# Altium schematic sheet Sheet2.SchDoc
size A; SheetNumber: 2; SheetTotal: 3
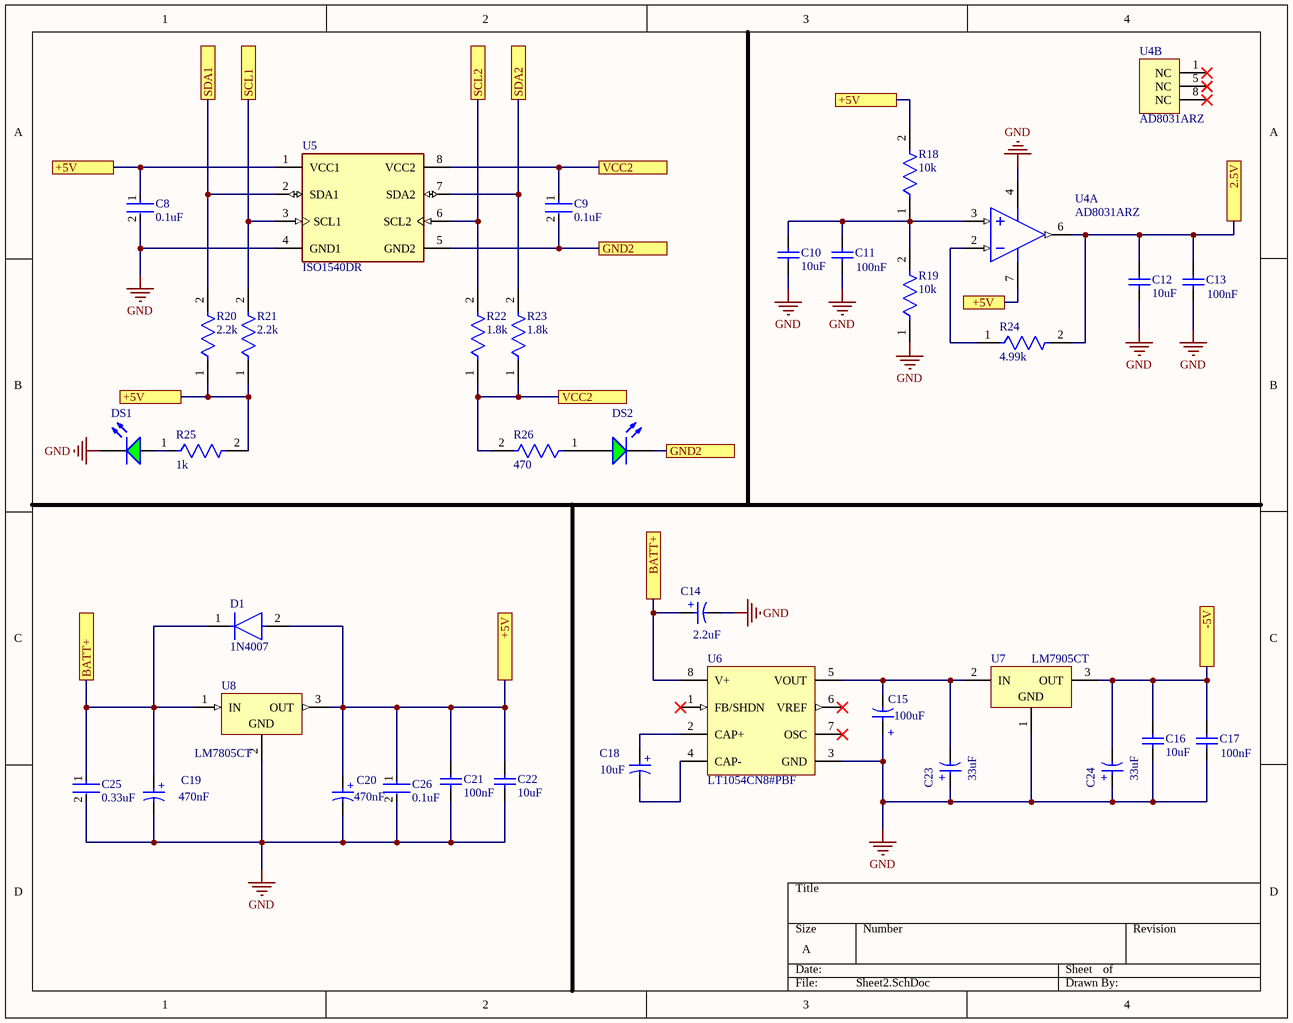
[diagram p0: Sheet2.SchDoc]

## Parts
C8  0.1uF  [FP-C1206C-EB-MFG]
C9  0.1uF  [FP-C1206C-EB-MFG]
C10  10uF  [CAPC1210(3225)230_M]
C11  100nF  [CAPC1210(3225)190_L]
C12  10uF  [CAPC1210(3225)230_M]
C13  100nF  [CAPC1210(3225)190_L]
C14  2.2uF  [WCAP-ATG8_D5H11]
C15  100uF  [WCAP-PTG5_D8H11.5]
C16  10uF  [CAPC1210(3225)230_M]
C17  100nF  [CAPC1210(3225)190_L]
C18  10uF  [WCAP-ATG5_D5H11]
C19  470nF  [WCAP-ATG5_D5H11]
C20  470nF  [WCAP-ATG5_D5H11]
C21  100nF  [CAPC1210(3225)190_L]
C22  10uF  [CAPC1210(3225)230_M]
C23  33uF  [WCAP-ATG5_D5H11]
C24  33uF  [WCAP-ATG5_D5H11]
C25  0.33uF  [FP-C0805C-DN-MFG]
C26  0.1uF  [FP-C1206C-EB-MFG]
D1  1N4007  [FP-1N4007-MFG]
DS1  (no value)  [LTST-C230KGKT_V]
DS2  (no value)  [LTST-C230KGKT_V]
R18  10k  [FP-ERJPA3-IPC_A]
R19  10k  [FP-ERJPA3-IPC_A]
R20  2.2k  [FP-ESR03-IPC_C]
R21  2.2k  [FP-ESR03-IPC_C]
R22  1.8k  [FP-ESR03-IPC_C]
R23  1.8k  [FP-ESR03-IPC_C]
R24  4.99k  [FP-AC1206-MFG]
R25  1k  [FP-ESR03-IPC_A]
R26  470  [FP-CRGP0603-IPC_C]
U4  AD8031ARZ  [ADI-R-8_L]  (parts A,B of 2)
U5  ISO1540DR  [FP-D0008A-MFG]
U6  LT1054CN8#PBF  [LT-N8-8]
U7  LM7905CT  [NDE0003A]
U8  LM7805CT  [FAIR-TO-220-3]

## Ports
2.5V, +5V, -5V, BATT+, GND2, SCL1, SCL2, SDA1, SDA2, VCC2

## Nets
GND: C8.2 C10.1 C11.1 C12.1 C13.1 C14.2(N) C15.1(P) C16.1 C17.1 C19.2(N) C20.2(N) C21.1 C22.1 C23.1(P) C24.1(P) C25.2 C26.2 DS1.2(K) R19.1 U4.4(-VS) U5.4(GND1) U6.3(GND) U7.1(GND) U8.2(GND)
2.5V: C12.2 C13.2 R24.2 U4.6(OUT) ; port 2.5V
+5V: C8.1 C20.1(P) C21.2 C22.2 C26.1 D1.2(A) R18.2 R20.1 R21.1 R25.2 U4.7(+VS) U5.1(VCC1) U8.3(OUT) ; port +5V
-5V: C16.2 C17.2 C24.2(N) U7.3(OUT) ; port -5V
BATT+: C14.1(P) C19.1(P) C25.1 D1.1(C) U6.8(V+) U8.1(IN) ; port BATT+
GND2: C9.2 DS2.2(K) U5.5(GND2) ; port GND2
SCL1: R21.2 U5.3(SCL1) ; port SCL1
SCL2: R22.2 U5.6(SCL2) ; port SCL2
SDA1: R20.2 U5.2(SDA1) ; port SDA1
SDA2: R23.2 U5.7(SDA2) ; port SDA2
VCC2: C9.1 R22.1 R23.1 R26.2 U5.8(VCC2) ; port VCC2
NetC10_2: C10.2 C11.2 R18.1 R19.2 U4.3(+IN)
NetC15_2: C15.2(N) C23.2(N) U6.5(VOUT) U7.2(IN)
NetC18_1: C18.1(P) U6.2(CAP+)
NetC18_2: C18.2(N) U6.4(CAP-)
NetDS1_1: DS1.1(A) R25.1
NetDS2_1: DS2.1(A) R26.1
NetR24_1: R24.1 U4.2(-IN)

Not connected (* = marked no-connect by the designer): U4 1(NC)* 5(NC)* 8(NC)*; U6 1(FB/SHDN)* 6(VREF)* 7(OSC)*

## Notes on the sheet
- (in symbol CMP-03913-53914227-2) +
- (in symbol CMP-03913-53914235-2) +
- (in symbol CMP-03913-53914252-2) +
- (in symbol CMP-03913-54007285-2) +
- (in symbol CMP-03913-54202572-2) +

## Library data of the parts
C8 C9 C26 = CMP-03020-004485-1: C1206 0.10 μF U2J 1.00% 25 V; Manufacturer: KEMET; Manufacturer Part Number: C1206C104F3JACAUTO; Value: 0.10 μF; Material: Ceramic; Voltage Rating: 25 V; Tolerance: 0.01; Temperature Coefficient: 15%; Automotive Grade: Grade 0; Temperature Range Low: -55°C; Temperature: -55°C to +150°C; Octopart: https://octopart.com/c1206c104f3jacauto-kemet-84732508; Device Class L3: Ceramic Capacitors; Category: Cap; Device Class L1: Passive Components; Package: C1206C-EB; Device Class L2: Capacitors; Height: 0.88mm; Automotive: Yes; Ipc Land Pattern Name: CAPC320160X78; Temperature Range High: +150°C; Capacitance: 0.10 μF; RoHS: TRUE; Temperature Characteristic: U2J; ComponentLink2Description: Datasheet; Lead Free: Yes; ComponentLink2URL: https://content.kemet.com/datasheets/KEM_C1007_X8R_ULTRA_150C_SMD.pdf
C10 C12 C16 C22 = CMP-1038-02200-3: CAP 10uF 10V ±20% 1210 (3225 Metric) Thickness 2.2mm SMD; Tolerance: Â±20%; Case-Metric: 3225; Case-EIA: 1210; Max Thickness: 2.2 mm; Technology: SMT; Value: 10uF; Rated Voltage: 10 V
C11 C13 C17 C21 = CMP-1038-01673-1: CAP 100nF 100V ±20% 1210 (3225 Metric) Thickness 1.9mm SMD; Case-EIA: 1210; Case-Metric: 3225; Tolerance: Â±20%; Technology: SMT; Max Thickness: 1.9 mm; Rated Voltage: 100 V; Value: 100nF
C14 = CMP-03913-54007285-2: WCAP-ATG8 Aluminum Electrolytic Capacitors; Manufacturer Lifecycle Status: ACTIVE; Life (Hours): 2000hours; Voltage Rating (DC): 63V; Leakage Current: 3µA; Pitch: 2mm; Polarity: Polar; YEOL: 1 = Estimated lifetime > 10 years; Ripple Current: 31mA; Capacitance: 2.2µF; Tolerance: 20%; Length: 11mm; Mount: Through Hole; RoHS: Compliant; REACH SVHC: Unknown; Lifecycle Status: Production; Height - Seated (Max): 12.4968mm; Min Operating Temperature: -40°C; Height: 11mm; Diameter: 5mm; Packaging: Tape & Box (TB); Lead Pitch: 2.0066mm; Max Operating Temperature: 85°C; Case/Package: Radial; Voltage Rating: 63V
C15 = CMP-03913-54202572-2: WCAP-PTG5 Aluminum Polymer Capacitors; Manufacturer Lifecycle Status: ACTIVE; Tolerance: 20%; YEOL: 1 = Estimated lifetime > 10 years; Pitch: 3.5mm; ESR (Equivalent Series Resistance): 12mΩ; Voltage Rating (DC): 16V; Life (Hours): 2000hours; Polarity: Polar; Capacitance: 100µF; Ripple Current: 4.8A; Leakage Current: 160µA; Mount: Through Hole; Case/Package: Radial; Min Operating Temperature: -55°C; Max Operating Temperature: 105°C; REACH SVHC: Unknown; RoHS: Compliant; Lead Pitch: 3.5052mm; Height - Seated (Max): 13.0048mm; Packaging: Tape & Box (TB); Voltage Rating: 16V; Diameter: 8mm; Length: 11.5mm; Lifecycle Status: Production
C18 = CMP-03913-53914252-2: WCAP-ATG5 Aluminum Electrolytic Capacitors; Manufacturer Lifecycle Status: ACTIVE; Leakage Current: 6.3µA; Material: Aluminium; Life (Hours): 2000hours; Polarity: Polar; Ripple Current: 42mA; Pitch: 2mm; Tolerance: 20%; Capacitance: 10µF; Voltage Rating: 63V; YEOL: 1 = Estimated lifetime > 10 years; Min Operating Temperature: -40°C; Case/Package: Radial; Length: 11mm; Mount: Through Hole; Height: 11mm; Diameter: 5mm; Packaging: Tape & Box (TB); REACH SVHC: Unknown; RoHS: Compliant; Height - Seated (Max): 12.4968mm; Lifecycle Status: Production; Voltage Rating (DC): 63V; Lead Pitch: 2.0066mm; Max Operating Temperature: 105°C
C19 C20 = CMP-03913-53914227-2: WCAP-ATG5 Aluminum Electrolytic Capacitors; Leakage Current: 3µA; Pitch: 2mm; Polarity: Polar; Life (Hours): 2000hours; Voltage Rating: 50V; Ripple Current: 7mA; Tolerance: 20%; Length: 11mm; Lead Pitch: 2.0066mm; RoHS: Compliant; Min Operating Temperature: -40°C; Case/Package: Radial; Height - Seated (Max): 12.4968mm; Packaging: Tape & Box (TB); Max Operating Temperature: 105°C; Capacitance: 470nF; REACH SVHC: Unknown; Voltage Rating (DC): 50V; Diameter: 5mm; Mount: Through Hole; Height: 11mm
C23 C24 = CMP-03913-53914235-2: WCAP-ATG5 Aluminum Electrolytic Capacitors; Capacitance: 33µF; Voltage Rating: 50V; Polarity: Polar; Life (Hours): 2000hours; Pitch: 2mm; Leakage Current: 16.5µA; Tolerance: 20%; Material: Aluminium; Ripple Current: 75mA; Max Operating Temperature: 105°C; Length: 11mm; REACH SVHC: Unknown; Case/Package: Radial; Mount: Through Hole; Diameter: 5mm; Min Operating Temperature: -40°C; Packaging: Tape & Box (TB); Height: 11mm; Voltage Rating (DC): 50V; RoHS: Compliant; Lead Pitch: 2.0066mm; Height - Seated (Max): 12.4968mm
C25 = CMP-2007-03276-2: CAP CER 0.33UF 25V X7R 0805; Manufacturer: KEMET; Manufacturer Part Number: C0805C334J3RACTU; Value: 0.33 μF; Material: Ceramic; Tolerance: 0.05; Temperature Coefficient: 30ppm/°C; Mouser Description: Capacitor, Ceramic, 330000Pf, 25Vdc, 5-% Tol, 5+% Tol, X7r-Tc Code, -15, 15%-Tc; Package: C0805C-DN; ComponentLink2URL: https://content.kemet.com/datasheets/KEM_C1003_C0G_SMD.pdf; RoHS: TRUE; Capacitance: 0.33 μF; Temperature: -55°C to +125°C; ComponentLink2Description: Datasheet; Temperature Range Low: -55°C; Automotive: No; Ipc Land Pattern Name: CAPC200125X78; Temperature Characteristic: X7R; Device Class L3: Ceramic Capacitors; Digikey Description: CAP CER 0.33UF 25V X7R 0805; Voltage Rating: 25 V; Device Class L1: Passive Components; Height: 0.88mm; Octopart: https://octopart.com/c0805c334j3ractu-kemet-9143333; Device Class L2: Capacitors; Category: Cap; Temperature Range High: +125°C; Lead Free: Yes
D1 = CMP-123542-000001-1: Rectifier diode 1000 V 1 A DO-41, ,; Manufacturer: Diotec; Max Surge Forward Current: 27A; Forward Current: 1A; Max Junction Temp: +175°C; Reverse Voltage: 1000V; Value: 15pF; Peak Reverse Current: 5uA; Category: Diode; Temperature Range Low: -50°C; Automotive: No; Temperature: -50°C to +175°C; Lead Free: Yes; ComponentLink2Description: Datasheet; Max Repetitive Reverse Voltage: 1000V; ComponentLink2URL: https://datasheet.octopart.com/1N4007-Diotec-datasheet-62346875.pdf; Manufacturer Part Number: 1N4007; Device Class L3: Rectifier Diodes; Height: 2.8mm; Octopart: https://octopart.com/1n4007-diotec-4040411; Package: 1N4007; Temperature Range High: +175°C; Device Class L1: Discrete Semiconductors; Device Class L2: Diodes; RoHS: TRUE; Capacitance: 15pF; Ipc Land Pattern Name: DIOAD888W100L520D280
DS1 DS2 = CMP-2000-06625-1: LED Green, 75 mW, 30 mA, -30 to 85 degC, 2-Pin SMD, RoHS, Tape and Reel; Manufacturer: Lite-On; Product Length (mm): 3.2mm; Type: Uni-Color; Peak Wavelength: 574nm; Shape Type: Rectangular; DELETED: Compliant; Lum Intensity: 35mcd; Forward Voltage: 2.4V; High Brightness: Yes; Rad Hardened: No; Power Dissipation: 75W; Forward Current: 30mA; Emitting Color: YellowGreen; Main Category: ChipLED; Product Height (mm): 1.1mm; Product Depth (mm): 1.6mm; Number of  Elements: 1; Viewing Angle: 130deg; Chip Material: AlGaInP; Dominant Wave Length: 571nm; Test Current (It): 20mA; Reverse Voltage: 5V; Mounting: SurfaceMount; Datasheet URL: http://optoelectronics.liteon.com/upload/download/DS22-2000-256/S_110_LTST-C230KGKT.pdf; Luminous Intensity: 35mcd; Pin Count: 2; Mounting Technology: SurfaceMount; Operating Temperature Classification: Industrial; Operating Temp Range: -55Cto85C; Package Type: ChipLed; Manufacturer URL: http://www.us.liteon.com/; Package Description: 2-Pin Surface Mount Device, Body 3.2 x 1.6 mm; Package Reference: C230KGKT; Datasheet Version: Rev. G, 12/2014; Lens Dimensions: 1.5X1.6X0.82mm; Packaging: TapeandReel
R18 R19 = CMP-05422-000155-1: RES SMD 10K OHM 1% 1/3W 0603; RoHS Compliant: Yes
R20 R21 = CMP-08839-028338-1: 2.2kΩ ±1% 0.25W 0603 Anti-Surge Chip Resistor AEC-Q200; Max Power Dissipation: 250mW; Temperature Coefficient: 100ppm/°C; Resistance: 2.2kR; Package Quantity: 5000; Series: ESR03; RoHS Compliant: Yes; Tolerance: 1%; Height: 0.022inch; Case/Package: 0603; Width: 0.031inch; Packaging: Tape and Reel; Number of Terminations: 2; Resistor Type: Thick Film; Max Operating Temperature: 155°C; Min Operating Temperature: -55°C; Length: 0.063inch
R22 R23 = CMP-08839-006074-1: 1.8kΩ ±1% 0.25W 0603 Anti-Surge Chip Resistor AEC-Q200; Temperature Coefficient: 100ppm/°C; Resistance: 1.8kR; Max Power Dissipation: 250mW; Length: 0.063inch; Number of Terminations: 2; RoHS Compliant: Yes; Min Operating Temperature: -55°C; Packaging: Tape and Reel; Width: 0.031inch; Case/Package: 0603; Max Operating Temperature: 155°C; Tolerance: 1%; Resistor Type: Thick Film; Series: ESR03; Package Quantity: 5000; Height: 0.022inch
R24 = CMP-03412-034001-1: RES SMD 4.99K OHM 1% 1/4W 1206; Manufacturer: Yageo; Manufacturer Part Number: AC1206FR-074K99L; Resistance: 4.99KΩ; Power Rating: 0.25W; Tolerance: 0.01; Value: 4.99KΩ; Automotive Grade: Grade 0; Voltage Rating: 200V; Composition: Thick Film; ComponentLink2Description: Datasheet; Height: 0.65mm; Device Class L2: Resistors; Footprint Url: http://www.yageo.com/exep/pages/download/literatures/PYu-R_Mount_10.pdf; Ipc Land Pattern Name: RESC310160X55; Temperature Range High: +155°C; Octopart: https://octopart.com/ac1206fr-074k99l-yageo-30511146; Lead Free: Yes; ComponentLink2URL: http://www.yageo.com/NewPortal/yageodocoutput?fileName=/pdf/R-Chip/PYu-AC_51_RoHS_L_6.pdf; Temperature Range Low: -55°C; Temperature: -55°C to +155°C; Automotive: Yes; Digikey Description: RES SMD 4.99K OHM 1% 1/4W 1206; Series: AC; Device Class L1: Passive Components; Package: AC1206; Category: Res; RoHS: TRUE; Device Class L3: Chip SMD Resistors
R25 = CMP-08839-029483-1: 1kΩ ±1% 0.25W 0603 Anti-Surge Chip Resistor AEC-Q200; Power Rating: 250mW; Resistance: 1kR; Temperature Coefficient: 100ppm/°C; Series: ESR; Max Operating Temperature: 155°C; Case Code (Metric): 1608; Package Quantity: 1; Case/Package: 0603; Size Code: 0603; Case Code (Imperial): 0603; Min Operating Temperature: -55°C; Tolerance: 1%; Max Power Dissipation: 250mW; Number of Terminations: 2; RoHS Compliant: Yes; Lead Free: Lead Free; Packaging: Tape and Reel; Height: 0.022inch; Width: 0.031inch; Features: Automotive AEC-Q200; Resistor Type: Thick Film; Length: 0.063inch
R26 = CMP-03211-005136-1: CRGP0603 470Ω 0.25W ±100ppm/°C 1% 50V; Manufacturer Part Number: CRGP0603F470R; Manufacturer: TE; Tolerance: 0.01; Ipc Land Pattern Name: RESC16080X45; Device Class L1: Passive Components; Temperature Range Low: -55°C; RoHS: TRUE; Composition: Thick Film; Temperature: -55°C to +155°C; ComponentLink2URL: https://www.te.com/commerce/DocumentDelivery/DDEController?Action=srchrtrv&DocNm=9-1773463-9&DocType=DS&DocLang=English; Series: CRGP; Package: CRGP0603; Resistance: 470Ω; Temperature Coefficient: ±100ppm/°C; Height: 0.55mm; Power Rating: 0.25W; Device Class L3: Chip SMD Resistors; Ambient Temperature Range High: +70°C; Lead Free: Yes; Category: Res; Device Class L2: Resistors; ComponentLink2Description: Datasheet; Value: 470Ω; Voltage Rating: 50V; Octopart: https://octopart.com/crgp0603f470r-te+connectivity-91018761; Automotive: No; Temperature Range High: +155°C
U4 = CMP-0384-01181-2: Single Channel RRIO Operational Amplifier, 80 MHz BW, 35 V/us SR, Industrial, 8-pin SOIC (R-8), Tube; Generic Part Number: AD8031; Manufacturer: Analog Devices; Iq/Amp: 900uA; V Span Max: 12V; Amplifiers Per Package: 1; Input Bias Current: 450nA; Slew Rate: 35V/us; Input Offset Voltage: 1mV; V Span Min: 2.7V; Small Signal Bandwidth: 80MHz; ComponentLink3URL: http://www.analog.com/static/imported-files/packages/PKG_PDF/SOIC_Narrow%20(R)/R_8.pdf; ComponentLink2Description: Datasheet; Mounting Technology: Surface Mount; Packing: Tube; ComponentLink3Description: Package Specification; PackageVersion: 060506-A; PartNumber: AD8031ARZ; RevisionNote: Reference Circuit URL fixed; ComponentLink2URL: http://www.analog.com/static/imported-files/data_sheets/AD8031_8032.pdf; PackageReference: R-8; ComponentLink1URL: http://www.analog.com/en/index.html; PackageDescription: 8-Pin Standard Small Outline Package, Body 3.9 x 4.9 mm, Pitch 1.27 mm; ComponentLink4URL: http://www.analog.com/en/all-operational-amplifiers-op-amps/operational-amplifiers-op-amps/ad8031/products/product.html#product-recommendations; Code_JEDEC: MS-012-AA; ComponentLink4Description: Reference Circuit; ComponentLink1Description: Manufacturer URL; DatasheetVersion: Rev. D
U5 = CMP-04872-000011-1: DGTL ISO 2.5KV 2CH I2C 8SOIC; Manufacturer: Texas Instruments; Max Supply Voltage: 5.5V; Interface: I2C,SMBus,Other; Nominal Supply Current: 1.7-3.1mA; Standoff Height: 0.11mm; Max Junction Temp: +136°C; Min Supply Voltage: 3V; Ipc Land Pattern Name: SOIC127P600X175-8; Ambient Temperature Range Low: -40°C; Temperature: -40°C to +125°C; Device Class L3: unset; Mouser Description: Digital Isolators Low-Power,Bidirec I2C Iso; Manufacturer Part Number: ISO1540DR; Octopart: https://octopart.com/iso1540dr-texas+instruments-24334113; Digikey Description: DGTL ISO 2.5KV 2CH I2C 8SOIC; Category: IC; Height: 1.75mm; Ambient Temperature Range High: +125°C; RoHS: TRUE; Automotive: No; Package: D0008A; ComponentLink2URL: http://www.ti.com/lit/ds/symlink/iso1540.pdf; Device Class L2: Interface ICs; Device Class L1: Integrated Circuits (ICs); Temperature Range Low: -40°C; Lead Free: Yes; ComponentLink2Description: Datasheet; Temperature Range High: +125°C
U6 = CMP-0475-00280-1: Switched-Capacitor Voltage Converter with Regulator, 3.5 to 15 V Vin, Adjustable Vout, 8-pin DIP (N8-8), 0 to 100 degC, Pb-Free; Manufacturer: Linear Technology; Voutput: Adj; Vin Max(V): 15; Isupply(mA): 2.5; Vin Min(V): 3.5; Frequency(kHz): 25; Ishutdown(uA): 100; PackageDescription: 8-Pin PDIP, Body 10.16 x 6.48 mm, Pitch 2.54 mm; DatasheetVersion: Rev. G; RoHS: TRUE; PackageReference: N8-8; ComponentLink1URL: http://www.linear.com/; PartNumber: LT1054CN8#PBF; ComponentLink2URL: http://cds.linear.com/docs/en/datasheet/1054lfg.pdf; PackageVersion: Rev. I, 07/2011; ComponentLink3URL: http://www.linear.com/docs/en/packaging/05081510_I_N8.pdf; Mounting Technology: Through Hole; Max Iout(mA): 100; ComponentLink3Description: Package Specification; ComponentLink2Description: Datasheet; ComponentLink1Description: Manufacturer URL
U7 = CMP-0062-02480-3: 3-Terminal Negative Regulator, 3-pin TO-220; Manufacturer: Texas Instruments; PowerWise: N; PackageTopMarking: NSUZXYTTE#*LM7905CT; CompType: LDO IC; PinCount: 3; PackageReference: NDE0003A; PackageDescription: TO-220, Molded, 3 Lead, Straight; ComponentLink1URL: http://www.ti.com/general/docs/lit/getliterature.tsp?genericPartNumber=LM7905&fileType=pdf; RoHS: N; ComponentLink1Description: Datasheet URL
U8 = CMP-2000-04938-1: Positive Voltage Regulator, 5 V, 1 A, -40 to 125 degC, 3-Pin TO-220, RoHS, Tube; Manufacturer: FairchildSemiconductor; Maximum Input Voltage: 35V; Maximum Quiescent Current: 8mA; Load Regulation: 100mV; Maximum Output Current: 2.2(Typ)A; Output Type: Fixed; Typical Dropout Voltage @ Current: 2@1AV; Rad Hard: No; Output Voltage: 5V; Accuracy: ±4%; Number of Outputs: 1; Category: LinearRegulator; Package Description: 3-Pin Through Hole Device, Body 10 x 4.5 mm, Pitch 2.54 mm; Packaging: Rail/Tube; Mounting: ThroughHole; Polarity: Positive; Manufacturer URL: https://www.fairchildsemi.com/; Line Regulation: 100mV; Datasheet Version: Aug-12; Datasheet URL: https://datasheet.ciiva.com/26904/lm7805ct-26904988.pdf; Package Reference: TO-220; Package URL: https://www.fairchildsemi.com/package-drawings/TO/TO220B03.pdf; Package: 3TO-220AB; Operating Temperature: -40to125degC; Type: Linear